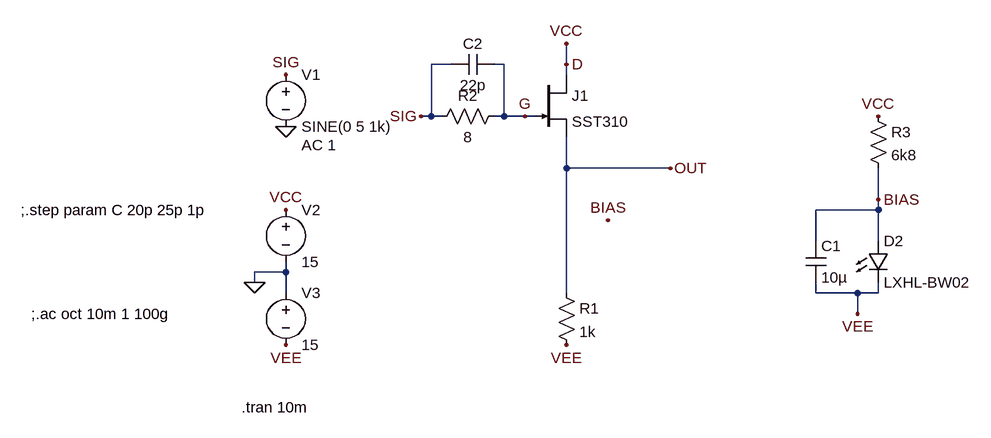
[diagram p0: schematic jfet-n_test.asc]
jfet-n_test.asc, the LTspice schematic file:
Version 4
SHEET 1 1144 680
WIRE 272 80 240 80
WIRE 352 80 336 80
WIRE 448 80 448 48
WIRE 448 96 448 80
WIRE 240 160 240 80
WIRE 240 160 224 160
WIRE 256 160 240 160
WIRE 352 160 352 80
WIRE 352 160 336 160
WIRE 384 160 352 160
WIRE 400 160 384 160
WIRE 448 240 448 192
WIRE 608 240 448 240
WIRE 928 288 928 240
WIRE 928 304 928 288
WIRE 928 304 832 304
WIRE 832 352 832 304
WIRE 928 352 928 304
WIRE 16 400 16 384
WIRE 16 400 -32 400
WIRE -32 416 -32 400
WIRE 16 432 16 400
WIRE 448 432 448 240
WIRE 832 432 832 416
WIRE 896 432 832 432
WIRE 928 432 928 416
WIRE 928 432 896 432
WIRE 896 464 896 432
FLAG 16 96 SIG
FLAG 16 176 0
FLAG 224 160 SIG
FLAG -32 416 0
FLAG 16 304 VCC
FLAG 16 512 VEE
FLAG 448 48 VCC
FLAG 928 160 VCC
FLAG 448 512 VEE
FLAG 896 464 VEE
FLAG 512 320 BIAS
FLAG 928 288 BIAS
FLAG 608 240 OUT
FLAG 384 160 G
FLAG 448 80 D
SYMBOL voltage 16 80 R0
WINDOW 123 24 124 Left 2
WINDOW 39 0 0 Left 0
SYMATTR InstName V1
SYMATTR Value SINE(0 5 1k)
SYMATTR Value2 AC 1
SYMBOL njf 400 96 R0
SYMATTR InstName J1
SYMATTR Value SST310
SYMBOL res 432 416 R0
SYMATTR InstName R1
SYMATTR Value 1k
SYMBOL res 352 144 R90
WINDOW 0 0 56 VBottom 2
WINDOW 3 32 56 VTop 2
SYMATTR InstName R2
SYMATTR Value 8
SYMBOL voltage 16 288 R0
WINDOW 123 0 0 Left 0
WINDOW 39 0 0 Left 0
SYMATTR InstName V2
SYMATTR Value 15
SYMBOL voltage 16 416 R0
WINDOW 123 0 0 Left 0
WINDOW 39 0 0 Left 0
SYMATTR InstName V3
SYMATTR Value 15
SYMBOL res 912 144 R0
SYMATTR InstName R3
SYMATTR Value 6k8
SYMBOL cap 816 352 R0
SYMATTR InstName C1
SYMATTR Value 10µ
SYMBOL LED 912 352 R0
SYMATTR InstName D2
SYMATTR Value LXHL-BW02
SYMBOL cap 336 64 R90
WINDOW 0 0 32 VBottom 2
WINDOW 3 32 32 VTop 2
SYMATTR InstName C2
SYMATTR Value 22p
TEXT -52 608 Left 2 !.tran 10m
TEXT -376 464 Left 2 !;.ac oct 10m 1 100g
TEXT -392 304 Left 2 !;.step param C 20p 25p 1p

The netlist it stands for:
* jfet-n_test.asc
V1 SIG 0 SINE(0 5 1k) AC 1
J1 D G OUT SST310
R1 OUT VEE 1k
R2 G SIG 8
V2 D 0 15
V3 0 VEE 15
R3 D BIAS 6k8
C1 BIAS VEE 10µ
D2 BIAS VEE LXHL-BW02
C2 G SIG 22p
.model D D
.lib standard.dio
.model NJF NJF
.model PJF PJF
.lib standard.jft
.tran 10m
;.ac oct 10m 1 100g
;.step param C 20p 25p 1p
.backanno
.end